# Altium project 19_PCB_Project_19.PrjPcb
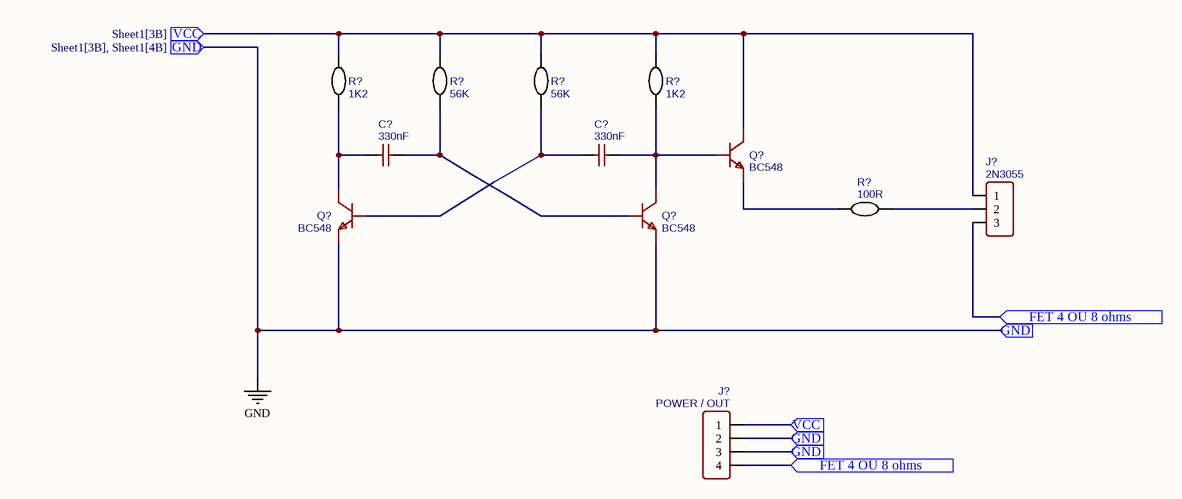
[diagram p0: Sheet1.SchDoc]
1 sheet, 12 parts. Net scope: flat (ports and power ports of the same name join across sheets).
Board file: PCB1.pcbdoc

## Sheet Sheet1.SchDoc
size A; SheetNumber: 1; SheetTotal: 1

### Parts
(Parts that share a designator on the sheet are numbered #1, #2 ... from top to bottom, then left to right.)
C?#1  330nF  [C1206]
C?#2  330nF  [C1206]
J?#1  2N3055  [HDR-M-2.54_1X3]
J?#2  POWER / OUT  [HDR-M-2.54_1X4]
Q?#1  BC548  [TO-92-3_L4.8-W3.7-P2.54-L]
Q?#2  BC548  [TO-92-3_L4.8-W3.7-P2.54-L]
Q?#3  BC548  [TO-92-3_L4.8-W3.7-P2.54-L]
R?#1  1K2  [RESISTOR SMD]
R?#2  56K  [RESISTOR SMD]
R?#3  56K  [RESISTOR SMD]
R?#4  1K2  [RESISTOR SMD]
R?#5  100R  [RESISTOR SMD]

### Ports
FET 4 OU 8 ohms (in, see Sheet1[3B]), FET 4 OU 8 ohms (in, see Sheet1[4B]), GND (in, see Sheet1[1A], Sheet1[3B]), GND (in, see Sheet1[1A], Sheet1[3B], Sheet1[4B]), GND (in, see Sheet1[3B], Sheet1[4B]), VCC (in, see Sheet1[1A]), VCC (in, see Sheet1[3B])

### Nets
GND: J?#2.2 J?#2.3 Q?#2.3(E) Q?#3.3(E) ; port GND
NetC?#1_1: C?#1.1 Q?#2.1(C) R?#1.01
NetC?#1_2: C?#1.2 Q?#3.2(B) R?#2.01
NetC?#2_1: C?#2.1 Q?#2.2(B) R?#3.01
NetC?#2_2: C?#2.2 Q?#1.2(B) Q?#3.1(C) R?#4.01
NetJ?#1_1: J?#1.1 J?#2.1 Q?#1.1(C) R?#1.02 R?#2.02 R?#3.02 R?#4.02 ; port VCC
NetJ?#1_2: J?#1.2 R?#5.01
NetJ?#1_3: J?#1.3 J?#2.4 ; port FET 4 OU 8 ohms
NetQ?#1_3: Q?#1.3(E) R?#5.02

### Library data of the parts
C?#1 C?#2 = 330nF: Manufacturer Part: C3216X7R2A334KT0L0U; Manufacturer: TDK; nameAlias: Capacitance; Supplier: LCSC; Supplier Part: C76670; spicePre: C; spiceSymbolName: C3216X7R2A334KT0L0U
J?#1 = 2N3055: Contributor: LCEDA_Lib; Supplier Part: C180248; Supplier: LCSC; spicePre: J; spiceSymbolName: HDR-M-2.54_1x3
J?#2 = POWER / OUT: Contributor: LCEDA_Lib; Package Display: No; Supplier Part: C124378; Supplier: LCSC; spicePre: J; spiceSymbolName: HDR-M-2.54_1x4
Q?#1-Q?#3 = BC548: Manufacturer: onsemi(安森美); Manufacturer Part: BC548CTA; Contributor: LCSC; Supplier: LCSC; Supplier Part: C900802; spicePre: Q; spiceSymbolName: BC548CTA
R?#1 R?#4 = 1K2: Contributor: End ti; spicePre: R; spiceSymbolName: resistor smd
R?#2 R?#3 = 56K: Contributor: End ti; spicePre: R; spiceSymbolName: resistor smd
R?#5 = 100R: Contributor: End ti; spicePre: R; spiceSymbolName: resistor smd